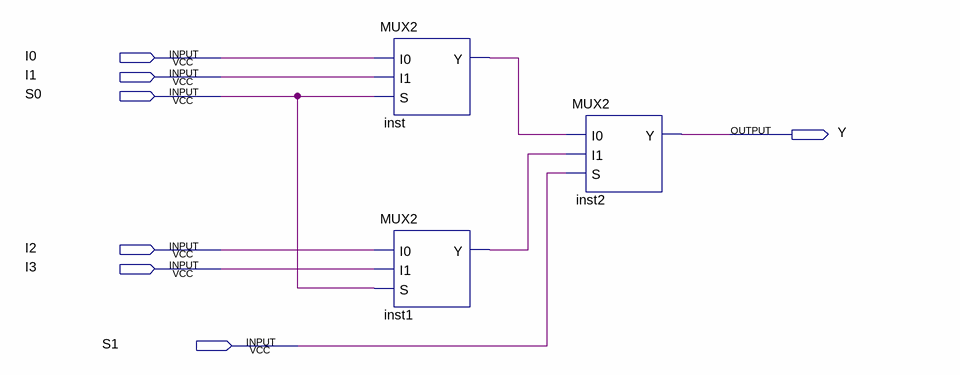
[diagram p0: schematic sheet]
// Quartus schematic MUX4.bdf as structural Verilog: 3 symbols, 7 pins
module MUX4 (
  input  I0,
  input  I1,
  input  S0,
  input  I2,
  input  I3,
  input  S1,
  output Y
);

  wire inst1_y, inst_y;

  MUX2 inst (.I0(I0), .I1(I1), .S(S0), .Y(inst_y));
  MUX2 inst1 (.I0(I2), .I1(I3), .S(S0), .Y(inst1_y));
  MUX2 inst2 (.I0(inst_y), .I1(inst1_y), .S(S1), .Y(Y));
endmodule
